# Altium schematic sheet LTC6952.SchDoc
size A3
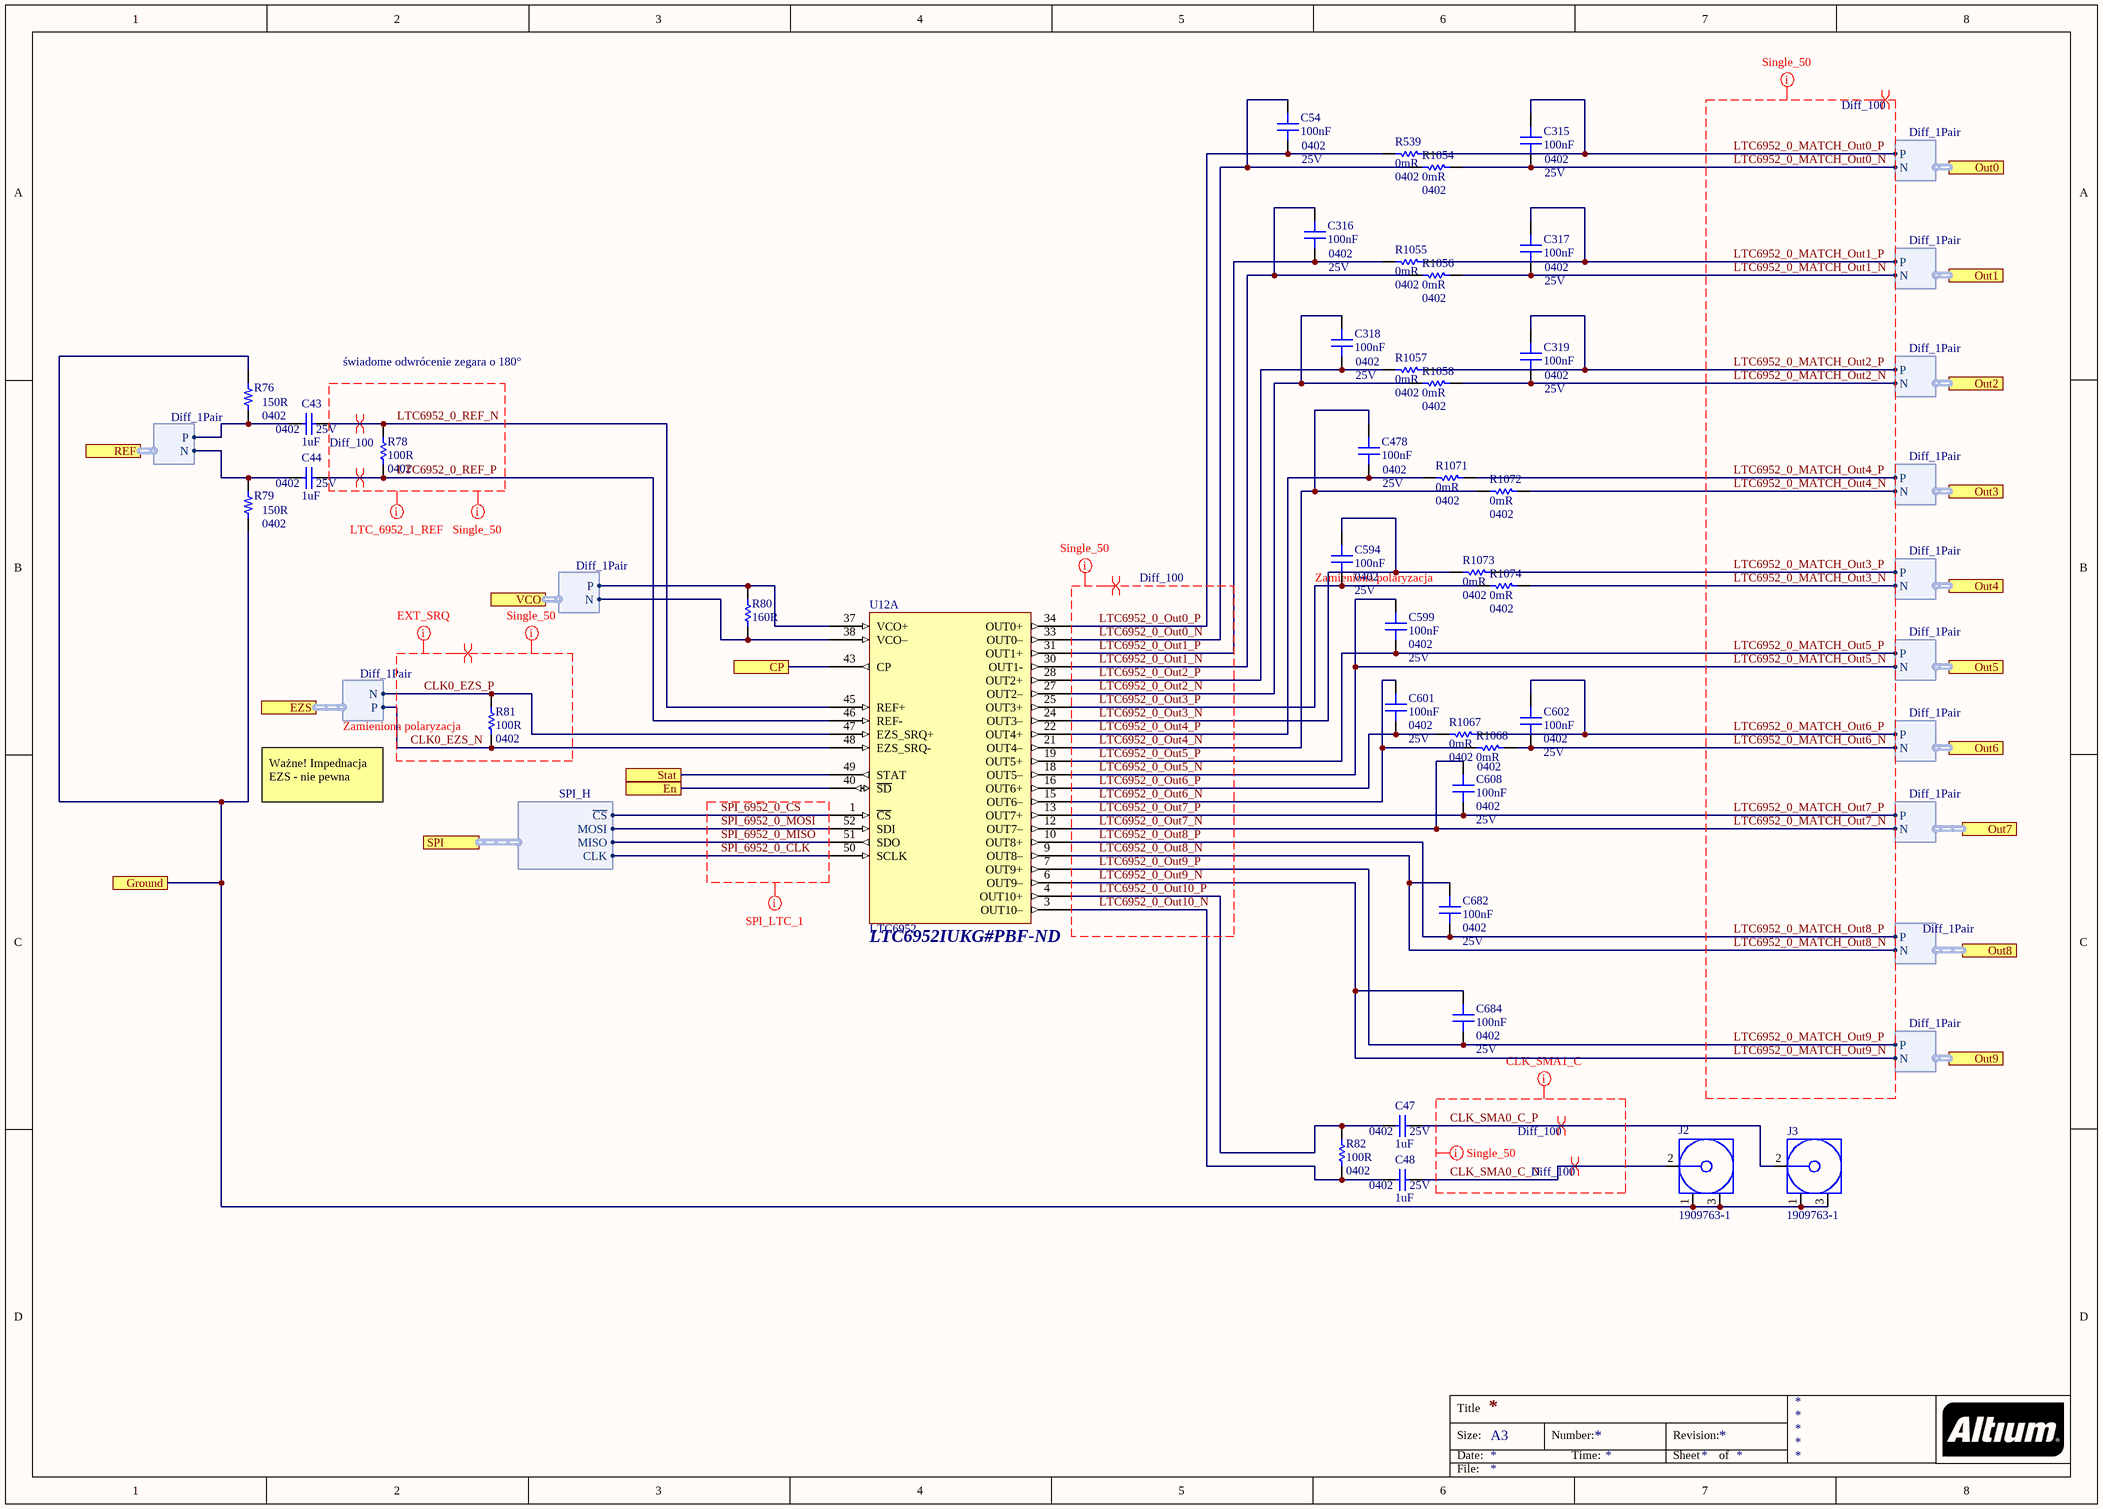
[diagram p0: LTC6952.SchDoc]

## Parts
C43  1uF  Case/Package: 0402  Voltage Rating: 25V  [CAP 0402/1005 KK]
C44  1uF  Case/Package: 0402  Voltage Rating: 25V  [CAP 0402/1005 KK]
C47  1uF  Case/Package: 0402  Voltage Rating: 25V  [CAP 0402/1005 KK]
C48  1uF  Case/Package: 0402  Voltage Rating: 25V  [CAP 0402/1005 KK]
C54  100nF  Case/Package: 0402  Voltage Rating: 25V  [CAP 0402/1005 KK]
C315  100nF  Case/Package: 0402  Voltage Rating: 25V  [CAP 0402/1005 KK]
C316  100nF  Case/Package: 0402  Voltage Rating: 25V  [CAP 0402/1005 KK]
C317  100nF  Case/Package: 0402  Voltage Rating: 25V  [CAP 0402/1005 KK]
C318  100nF  Case/Package: 0402  Voltage Rating: 25V  [CAP 0402/1005 KK]
C319  100nF  Case/Package: 0402  Voltage Rating: 25V  [CAP 0402/1005 KK]
C478  100nF  Case/Package: 0402  Voltage Rating: 25V  [CAP 0402/1005 KK]
C594  100nF  Case/Package: 0402  Voltage Rating: 25V  [CAP 0402/1005 KK]
C599  100nF  Case/Package: 0402  Voltage Rating: 25V  [CAP 0402/1005 KK]
C601  100nF  Case/Package: 0402  Voltage Rating: 25V  [CAP 0402/1005 KK]
C602  100nF  Case/Package: 0402  Voltage Rating: 25V  [CAP 0402/1005 KK]
C608  100nF  Case/Package: 0402  Voltage Rating: 25V  [CAP 0402/1005 KK]
C682  100nF  Case/Package: 0402  Voltage Rating: 25V  [CAP 0402/1005 KK]
C684  100nF  Case/Package: 0402  Voltage Rating: 25V  [CAP 0402/1005 KK]
J2  1909763-1  [TECO-1909763-1_V]
J3  1909763-1  [TECO-1909763-1_V]
R76  150R  Case/Package: 0402  [RES 0402/1005 RF KK]
R78  100R  Case/Package: 0402  [RES 0402/1005 RF KK]
R79  150R  Case/Package: 0402  [RES 0402/1005 RF KK]
R80  160R  [RES 0402/1005 RF KK]
R81  100R  Case/Package: 0402  [RES 0402/1005 RF KK]
R82  100R  Case/Package: 0402  [RES 0402/1005 RF KK]
R539  0mR  Case/Package: 0402  [RES 0402/1005 RF KK]
R1054  0mR  Case/Package: 0402  [RES 0402/1005 RF KK]
R1055  0mR  Case/Package: 0402  [RES 0402/1005 RF KK]
R1056  0mR  Case/Package: 0402  [RES 0402/1005 RF KK]
R1057  0mR  Case/Package: 0402  [RES 0402/1005 RF KK]
R1058  0mR  Case/Package: 0402  [RES 0402/1005 RF KK]
R1067  0mR  Case/Package: 0402  [RES 0402/1005 RF KK]
R1068  0mR  Case/Package: 0402  [RES 0402/1005 RF KK]
R1071  0mR  Case/Package: 0402  [RES 0402/1005 RF KK]
R1072  0mR  Case/Package: 0402  [RES 0402/1005 RF KK]
R1073  0mR  Case/Package: 0402  [RES 0402/1005 RF KK]
R1074  0mR  Case/Package: 0402  [RES 0402/1005 RF KK]
U12  LTC6952  Supplier Part Number 1: LTC6952IUKG#PBF-ND  [LTC6952]  (part A of 2)

## Ports
CP, En, EZS (harness Diff_1Pair), Ground, Out0 (harness Diff_1Pair), Out1 (harness Diff_1Pair), Out2 (harness Diff_1Pair), Out3 (harness Diff_1Pair), Out4 (harness Diff_1Pair), Out5 (harness Diff_1Pair), Out6 (harness Diff_1Pair), Out7 (harness Diff_1Pair), Out8 (harness Diff_1Pair), Out9 (harness Diff_1Pair), REF (harness Diff_1Pair), SPI (harness SPI_H), Stat, VCO (harness Diff_1Pair)

## Harnesses
SPI_H: CLK, MISO, MOSI, ~{CS}
Diff_1Pair: N, P

## Nets
CLK0_EZS_N: R81.1 U12.48(EZS_SRQ-) ; port EZS.P
CLK0_EZS_P: R81.2 U12.47(EZS_SRQ+) ; port EZS.N
CLK_SMA0_C_N: C48.1 J2.2
CLK_SMA0_C_P: C47.1 J3.2
CP: U12.43(CP) ; port CP
En: U12.40(~{SD}) ; port En
Ground: J2.1 J2.3 J3.1 J3.3 R76.2 R79.1 ; port Ground
LTC6952_0_MATCH_Out0_N: C315.1 R1054.1 ; port Out0.N
LTC6952_0_MATCH_Out0_P: C315.2 R539.1 ; port Out0.P
LTC6952_0_MATCH_Out1_N: C317.1 R1056.1 ; port Out1.N
LTC6952_0_MATCH_Out1_P: C317.2 R1055.1 ; port Out1.P
LTC6952_0_MATCH_Out2_N: C319.1 R1058.1 ; port Out2.N
LTC6952_0_MATCH_Out2_P: C319.2 R1057.1 ; port Out2.P
LTC6952_0_MATCH_Out3_N: R1074.1 ; port Out4.N
LTC6952_0_MATCH_Out3_P: R1073.1 ; port Out4.P
LTC6952_0_MATCH_Out4_N: R1072.2 ; port Out3.N
LTC6952_0_MATCH_Out4_P: R1071.2 ; port Out3.P
LTC6952_0_MATCH_Out5_N: C599.1 U12.18(OUT5–) ; port Out5.N  [also labelled LTC6952_0_Out5_N]
LTC6952_0_MATCH_Out5_P: C599.2 U12.19(OUT5+) ; port Out5.P  [also labelled LTC6952_0_Out5_P]
LTC6952_0_MATCH_Out6_N: C602.2 R1068.1 ; port Out6.N
LTC6952_0_MATCH_Out6_P: C602.1 R1067.1 ; port Out6.P
LTC6952_0_MATCH_Out7_N: C608.1 U12.12(OUT7–) ; port Out7.N  [also labelled LTC6952_0_Out7_N]
LTC6952_0_MATCH_Out7_P: C608.2 U12.13(OUT7+) ; port Out7.P  [also labelled LTC6952_0_Out7_P]
LTC6952_0_MATCH_Out8_N: C682.1 U12.9(OUT8–) ; port Out8.N  [also labelled LTC6952_0_Out8_N]
LTC6952_0_MATCH_Out8_P: C682.2 U12.10(OUT8+) ; port Out8.P  [also labelled LTC6952_0_Out8_P]
LTC6952_0_MATCH_Out9_N: C684.1 U12.6(OUT9–) ; port Out9.N  [also labelled LTC6952_0_Out9_N]
LTC6952_0_MATCH_Out9_P: C684.2 U12.7(OUT9+) ; port Out9.P  [also labelled LTC6952_0_Out9_P]
LTC6952_0_Out0_N: C54.2 R1054.2 U12.33(OUT0–)
LTC6952_0_Out0_P: C54.1 R539.2 U12.34(OUT0+)
LTC6952_0_Out1_N: C316.2 R1056.2 U12.30(OUT1-)
LTC6952_0_Out1_P: C316.1 R1055.2 U12.31(OUT1+)
LTC6952_0_Out2_N: C318.2 R1058.2 U12.27(OUT2–)
LTC6952_0_Out2_P: C318.1 R1057.2 U12.28(OUT2+)
LTC6952_0_Out3_N: C594.1 R1073.2 U12.24(OUT3–)
LTC6952_0_Out3_P: C594.2 R1074.2 U12.25(OUT3+)
LTC6952_0_Out4_N: C478.2 R1072.1 U12.21(OUT4–)
LTC6952_0_Out4_P: C478.1 R1071.1 U12.22(OUT4+)
LTC6952_0_Out6_N: C601.1 R1068.2 U12.15(OUT6–)
LTC6952_0_Out6_P: C601.2 R1067.2 U12.16(OUT6+)
LTC6952_0_Out10_N: C48.2 R82.1 U12.3(OUT10–)
LTC6952_0_Out10_P: C47.2 R82.2 U12.4(OUT10+)
LTC6952_0_REF_N: C43.1 R78.2 U12.45(REF+)
LTC6952_0_REF_P: C44.1 R78.1 U12.46(REF-)
SPI_6952_0_CLK: U12.50(SCLK) ; port SPI.CLK
SPI_6952_0_CS: U12.1(~{CS}) ; port SPI.~{CS}
SPI_6952_0_MISO: U12.51(SDO) ; port SPI.MISO
SPI_6952_0_MOSI: U12.52(SDI) ; port SPI.MOSI
Stat: U12.49(STAT) ; port Stat
NetC43_2: C43.2 R76.1 ; port REF.P
NetC44_2: C44.2 R79.2 ; port REF.N
NetR80_1: R80.1 U12.38(VCO–) ; port VCO.N
NetR80_2: R80.2 U12.37(VCO+) ; port VCO.P

## Layout directives
differential pair; differential pair class Diff_100: CLK0_EZS_N, CLK0_EZS_P, CLK_SMA0_C_N, CLK_SMA0_C_P, LTC6952_0_MATCH_Out0_N, LTC6952_0_MATCH_Out0_P, LTC6952_0_MATCH_Out1_N, LTC6952_0_MATCH_Out1_P, LTC6952_0_MATCH_Out2_N, LTC6952_0_MATCH_Out2_P, LTC6952_0_MATCH_Out3_N, LTC6952_0_MATCH_Out3_P, LTC6952_0_MATCH_Out4_N, LTC6952_0_MATCH_Out4_P, LTC6952_0_MATCH_Out5_N, LTC6952_0_MATCH_Out5_P, LTC6952_0_MATCH_Out6_N, LTC6952_0_MATCH_Out6_P, LTC6952_0_MATCH_Out7_N, LTC6952_0_MATCH_Out7_P, LTC6952_0_MATCH_Out8_N, LTC6952_0_MATCH_Out8_P, LTC6952_0_MATCH_Out9_N, LTC6952_0_MATCH_Out9_P, LTC6952_0_Out0_N, LTC6952_0_Out0_P, LTC6952_0_Out1_N, LTC6952_0_Out1_P, LTC6952_0_Out2_N, LTC6952_0_Out2_P, LTC6952_0_Out3_N, LTC6952_0_Out3_P, LTC6952_0_Out4_N, LTC6952_0_Out4_P, LTC6952_0_Out5_N, LTC6952_0_Out5_P, LTC6952_0_Out6_N, LTC6952_0_Out6_P, LTC6952_0_Out7_N, LTC6952_0_Out7_P, LTC6952_0_Out8_N, LTC6952_0_Out8_P, LTC6952_0_Out9_N, LTC6952_0_Out9_P, LTC6952_0_Out10_N, LTC6952_0_Out10_P, LTC6952_0_REF_N, LTC6952_0_REF_P
net class Single_50: CLK0_EZS_N, CLK0_EZS_P, CLK_SMA0_C_N, CLK_SMA0_C_P, LTC6952_0_MATCH_Out0_N, LTC6952_0_MATCH_Out0_P, LTC6952_0_MATCH_Out1_N, LTC6952_0_MATCH_Out1_P, LTC6952_0_MATCH_Out2_N, LTC6952_0_MATCH_Out2_P, LTC6952_0_MATCH_Out3_N, LTC6952_0_MATCH_Out3_P, LTC6952_0_MATCH_Out4_N, LTC6952_0_MATCH_Out4_P, LTC6952_0_MATCH_Out5_N, LTC6952_0_MATCH_Out5_P, LTC6952_0_MATCH_Out6_N, LTC6952_0_MATCH_Out6_P, LTC6952_0_MATCH_Out7_N, LTC6952_0_MATCH_Out7_P, LTC6952_0_MATCH_Out8_N, LTC6952_0_MATCH_Out8_P, LTC6952_0_MATCH_Out9_N, LTC6952_0_MATCH_Out9_P, LTC6952_0_Out0_N, LTC6952_0_Out0_P, LTC6952_0_Out1_N, LTC6952_0_Out1_P, LTC6952_0_Out2_N, LTC6952_0_Out2_P, LTC6952_0_Out3_N, LTC6952_0_Out3_P, LTC6952_0_Out4_N, LTC6952_0_Out4_P, LTC6952_0_Out5_N, LTC6952_0_Out5_P, LTC6952_0_Out6_N, LTC6952_0_Out6_P, LTC6952_0_Out7_N, LTC6952_0_Out7_P, LTC6952_0_Out8_N, LTC6952_0_Out8_P, LTC6952_0_Out9_N, LTC6952_0_Out9_P, LTC6952_0_Out10_N, LTC6952_0_Out10_P, LTC6952_0_REF_N, LTC6952_0_REF_P
net class CLK_SMA1_C: CLK_SMA0_C_N, CLK_SMA0_C_P
net class LTC_6952_1_REF: LTC6952_0_REF_N, LTC6952_0_REF_P
net class EXT_SRQ: CLK0_EZS_N, CLK0_EZS_P
net class SPI_LTC_1: SPI_6952_0_CLK, SPI_6952_0_CS, SPI_6952_0_MISO, SPI_6952_0_MOSI

## Notes on the sheet
- świadome odwrócenie zegara o 180°
- (near C594) Zamieniona polaryzacja
- (near R81) Zamieniona polaryzacja
- Ważne! Impednacja EZS - nie pewna
- Title
- Size:
- Date:
- A3
- Number:
- Time:
- Revision:
- Sheet
- of
- File:

## Library data of the parts
C43 C44 C47 C48 = Capacitor: MURATA - GRT155R61E105KE01D - SMD Multilayer Ceramic Capacitor, 1 µF, 25 V, 0402 [1005 Metric], ± 10%, X5R, GRT Series - SMD Multilayer Ceramic Capacitor, 1 µF, 25 V, 0402 [1005 Metric], ± 10%, X5R, GRT Series; Supplier 1: Digi-Key; Supplier Part Number 1: 490-12263-1-ND; Manufacturer: Murata; Manufacturer Part Number: GRT155R61E105KE01D; RoHS: Yes; Category: Ceramic Capacitors; Stock 1: 341453; Pricing 1: 1=0,18000, 10=0,12300, 100=0,06210, 500=0,04248, 1000=0,03758, 2500=0,03594, 5000=0,03268 (USD); Mount: Surface Mount; Case Code (Metric): 1005; Case Code (Imperial): 0402; Min Operating Temperature: -55°C; Max Operating Temperature: 85°C; Packaging: Tape and Reel; Capacitance: 1uF; Tolerance: 10%; Dielectric: X5R; Voltage Rating (DC): 25V; Length: 0.039inch; Width: 0.02inch; Thickness: 0.022inch; Ratings: AEC-Q200; ComponentLink1URL: http://www.farnell.com/datasheets/2165918.pdf?src-supplier=Farnell; ComponentLink1Description: http://www.farnell.com/datasheets/2165918.pdf?src-supplier=Farnell; ComponentLink2URL: http://search.murata.co.jp/Ceramy/image/img/A01X/G101/ENG/GRT155R61E105KE01-01.pdf?src-supplier=Digi-Key; ComponentLink2Description: http://search.murata.co.jp/Ceramy/image/img/A01X/G101/ENG/GRT155R61E105KE01-01.pdf?src-supplier=Digi-Key; ComponentLink3URL: http://www.farnell.com/datasheets/2165918.pdf?src-supplier=Element14; ComponentLink3Description: http://www.farnell.com/datasheets/2165918.pdf?src-supplier=Element14
C54 C315-C319 C478 C594 C599 C601 C602 C608 C682 C684 = Capacitor: Manufacturer: Murata; Manufacturer Part Number: GRM155R71E104KE14J; Tolerance: 10%; Dielectric: X7R; Supplier 1: Digi-Key; Supplier Part Number 1: 490-14603-1-ND; Stock 1: 89275; Pricing 1: 1 = 0,10000, 10 = 0,03400, 100 = 0,01520, 500 = 0,01088, 1000 = 0,00855, 2500 = 0,00778, 5000 = 0,00715 (USD); RoHS: Yes; Mount: Surface Mount; Weight: 0.000212oz; Case Code (Imperial): 0402; Case Code (Metric): 1005; Min Operating Temperature: -55°C; Max Operating Temperature: 125°C; Packaging: Tape and Reel; Capacitance: 100nF; Termination: SMD/SMT; Composition: Ceramic; Voltage Rating (DC): 25V; Package Quantity: 50000; Length: 0.039inch; Height: 0.5mm; Width: 0.5mm; Thickness: 0.022inch; ComponentLink1URL: http://www.mouser.com/ds/2/281/c02e-2905.pdf?src-supplier=Mouser; ComponentLink1Description: http://www.mouser.com/ds/2/281/c02e-2905.pdf?src-supplier=Mouser; ComponentLink2URL: http://search.murata.co.jp/Ceramy/image/img/A01X/G101/ENG/GRM155R71E104KE14-01.pdf?src-supplier=Digi-Key; ComponentLink2Description: http://search.murata.co.jp/Ceramy/image/img/A01X/G101/ENG/GRM155R71E104KE14-01.pdf?src-supplier=Digi-Key
J2 J3 = 1909763-1: Ultra Miniature Coaxial Connector Jack, 60 V, 50 Ohm, -40 to 90 degC, RoHS, Tape and Reel; Brand: TE Connectivity / AMP; Maximum Frequency: 6 GHz; Gender: Jack (Female); Body Material: Liquid Crystal Polymer (LCP); RF Series: UMCC; Impedance: 50 Ohms; DatasheetVersion: Rev. B2; PackageReference: SMD; PackageDescription: 3-Pin Surface Mount Device, Body 2.6 x 2.6 mm; Supplier 1: Newark; Supplier Part Number 1: 62X0488; Supplier 2: Farnell; Supplier Part Number 2: 2781689; Supplier 3: Digi-Key; Supplier Part Number 3: A118077TR-ND; Supplier 4: Digi-Key; Supplier Part Number 4: A118077CT-ND; Supplier 5: Digi-Key; Supplier Part Number 5: A118077DKR-ND; Product Category: RF Connectors / Coaxial Connectors; Packaging: Reel; Product: Connectors; Orientation: Straight; Operating Temperature Range: - 40 C to + 90 C; Factory Pack Quantity: 5000; RoHS: Details; Contact Plating: Gold; Contact Material: Copper Alloy; Mounting Technology: Surface Mount; ComponentLink1Description: Manufacturer URL; ComponentLink1URL: http://www.te.com; ComponentLink2Description: Datasheet; ComponentLink2URL: http://www.te.com/commerce/DocumentDelivery/DDEController?Action=srchrtrv&DocNm=1909763&DocType=Customer+Drawing&DocLang=English
R76 R79 = Resistor: RES SMD 150 OHM 1% 1/10W 0402; Manufacturer: Panasonic; Manufacturer Part Number: ERJ-2RKF1500X; Temperature Coefficient: 100ppm/°C; Power Rating: 100mW; Voltage Rating: 50V; Supplier 1: Digi-Key; Supplier Part Number 1: P150LCT-ND; RoHS: Yes; Category: Chip SMD Resistors; Stock 1: 1074892; Pricing 1: 1=0,10000, 10=0,04100, 100=0,01670, 1000=0,00751, 2500=0,00652, 5000=0,00538 (USD); Mount: Surface Mount; Number of Pins: 2; Contact Plating: Tin; Case Code (Metric): 1005; Case Code (Imperial): 0402; Min Operating Temperature: -55°C; Max Operating Temperature: 155°C; Resistance: 150R; Tolerance: 1%; Composition: Thick Film; Packaging: Tape and Reel; Package Quantity: 1; Number of Terminations: 2; Termination: SMD/SMT; Military Standard: Not; Max Power Dissipation: 100mW; Voltage Rating (DC): 50V; Features: Automotive AEC-Q200; Length: 1mm; Height: 0.35mm; Width: 0.02inch; Depth: 0.5mm; Radiation Hardening: No; REACH SVHC: No SVHC; Lead Free: Lead Free; ComponentLink1URL: https://datasheet.ciiva.com/34303/1987126-34303555.pdf?src-supplier=Jameco; ComponentLink1Description: https://datasheet.ciiva.com/34303/1987126-34303555.pdf?src-supplier=Jameco; ComponentLink2URL: https://datasheet.ciiva.com/11821/0900766b80f80784-11821183.pdf?src-supplier=RSComponents; ComponentLink2Description: https://datasheet.ciiva.com/11821/0900766b80f80784-11821183.pdf?src-supplier=RSComponents; ComponentLink3URL: https://datasheet.ciiva.com/16774/70260748-16774549.pdf?src-supplier=Allied+Electronics; ComponentLink3Description: https://datasheet.ciiva.com/16774/70260748-16774549.pdf?src-supplier=Allied+Electronics; ComponentLink4URL: https://datasheet.ciiva.com/43467/1678782-43467237.pdf?src-supplier=Farnell; ComponentLink4Description: https://datasheet.ciiva.com/43467/1678782-43467237.pdf?src-supplier=Farnell; ComponentLink5URL: https://datasheet.ciiva.com/7887/426256-7887016.pdf?src-supplier=Element14; ComponentLink5Description: https://datasheet.ciiva.com/7887/426256-7887016.pdf?src-supplier=Element14; ComponentLink6URL: https://datasheet.ciiva.com/16371/aoa0000ce2-16371497.pdf?src-supplier=Future+Electronics; ComponentLink6Description: https://datasheet.ciiva.com/16371/aoa0000ce2-16371497.pdf?src-supplier=Future+Electronics; ComponentLink7URL: https://datasheet.ciiva.com/7886/aoa0000ce2-7886714.pdf?src-supplier=Element14; ComponentLink7Description: https://datasheet.ciiva.com/7886/aoa0000ce2-7886714.pdf?src-supplier=Element14; ComponentLink8URL: https://datasheet.ciiva.com/46373/1678782-46373162.pdf?src-supplier=Element14; ComponentLink8Description: https://datasheet.ciiva.com/46373/1678782-46373162.pdf?src-supplier=Element14; ComponentLink9URL: https://datasheet.ciiva.com/46373/1678782-46373163.pdf?src-supplier=Element14; ComponentLink9Description: https://datasheet.ciiva.com/46373/1678782-46373163.pdf?src-supplier=Element14; ComponentLink10URL: https://datasheet.ciiva.com/16770/70260748-16770572.pdf?src-supplier=Allied+Electronics; ComponentLink10Description: https://datasheet.ciiva.com/16770/70260748-16770572.pdf?src-supplier=Allied+Electronics; ComponentLink11URL: https://datasheet.ciiva.com/17207/aoa0000ce2-17207389.pdf?src-supplier=Avnet+Europe; ComponentLink11Description: https://datasheet.ciiva.com/17207/aoa0000ce2-17207389.pdf?src-supplier=Avnet+Europe; ComponentLink12URL: https://datasheet.ciiva.com/28568/1678782-28568846.pdf?src-supplier=Element14; ComponentLink12Description: https://datasheet.ciiva.com/28568/1678782-28568846.pdf?src-supplier=Element14; ComponentLink13URL: https://datasheet.ciiva.com/30106/aoa0000ce2-30106926.pdf?src-supplier=Onlinecomponents.com; ComponentLink13Description: https://datasheet.ciiva.com/30106/aoa0000ce2-30106926.pdf?src-supplier=Onlinecomponents.com; ComponentLink14URL: https://datasheet.ciiva.com/22673/1678782-22673679.pdf?src-supplier=Element14; ComponentLink14Description: https://datasheet.ciiva.com/22673/1678782-22673679.pdf?src-supplier=Element14
R78 R81 R82 = Resistor: RES SMD 100 OHM 1% 1/16W 0402; Manufacturer: Yageo; Manufacturer Part Number: RC0402FR-07100RL; Power Rating: 62.5mW; Voltage Rating: 50V; Temperature Coefficient: 100ppm/°C; Supplier 1: Digi-Key; Supplier Part Number 1: 311-100LRDKR-ND; RoHS: Yes; Category: Chip SMD Resistors; Stock 1: 42078262; Pricing 1: 1=0,10000, 10=0,01600, 100=0,00640, 1000=0,00289, 2500=0,00251, 5000=0,00207 (USD); Number of Pins: 2; Case Code (Imperial): 0402; Case Code (Metric): 1005; Min Operating Temperature: -55°C; Max Operating Temperature: 155°C; Tolerance: 1%; Resistance: 100R; Packaging: Tape and Reel; Termination: SMD/SMT; Composition: Thick Film; Military Standard: Not; Voltage Rating (DC): 50V; Length: 1mm; Height: 0.32mm; Depth: 0.5mm; Width: 0.5mm; REACH SVHC: No SVHC; Lead Free: Lead Free; ComponentLink1URL: https://datasheet.ciiva.com/7849/1784430-7849810.pdf?src-supplier=Element14; ComponentLink1Description: https://datasheet.ciiva.com/7849/1784430-7849810.pdf?src-supplier=Element14; ComponentLink2URL: https://datasheet.ciiva.com/11808/0900766b80c66297-11808765.pdf?src-supplier=RSComponents; ComponentLink2Description: https://datasheet.ciiva.com/11808/0900766b80c66297-11808765.pdf?src-supplier=RSComponents; ComponentLink3URL: https://datasheet.ciiva.com/12667/pyu-rc0402-51-rohs-l-6-r-12667957.pdf?src-supplier=Mouser; ComponentLink3Description: https://datasheet.ciiva.com/12667/pyu-rc0402-51-rohs-l-6-r-12667957.pdf?src-supplier=Mouser; ComponentLink4URL: https://datasheet.ciiva.com/16740/pyu-rc0402-51-rohs-l-6-r-16740566.pdf?src-supplier=Future+Electronics; ComponentLink4Description: https://datasheet.ciiva.com/16740/pyu-rc0402-51-rohs-l-6-r-16740566.pdf?src-supplier=Future+Electronics; ComponentLink5URL: https://datasheet.ciiva.com/15189/getdatasheetpartid-329466-15189335.pdf?src-supplier=Verical; ComponentLink5Description: https://datasheet.ciiva.com/15189/getdatasheetpartid-329466-15189335.pdf?src-supplier=Verical; ComponentLink6URL: https://datasheet.ciiva.com/28367/1018594-28367226.pdf?src-supplier=Element14; ComponentLink6Description: https://datasheet.ciiva.com/28367/1018594-28367226.pdf?src-supplier=Element14; ComponentLink7URL: https://datasheet.ciiva.com/22747/1018594-22747511.pdf?src-supplier=Element14; ComponentLink7Description: https://datasheet.ciiva.com/22747/1018594-22747511.pdf?src-supplier=Element14
R80 = Resistor: Res Thick Film 0402 160 Ohm 1% 1/16W 100ppm/C Molded SMD SMD Paper T/R; Manufacturer: Stackpole Electronics; Manufacturer Part Number: RMCF0402FT160R; Temperature Coefficient: 100ppm/°C; Supplier 1: Digi-Key; Supplier Part Number 1: RMCF0402FT160RCT-ND; RoHS: Yes; Category: Chip SMD Resistors; Stock 1: 34661; Pricing 1: 1=0,10000, 10=0,01400, 100=0,00580, 1000=0,00262, 2500=0,00228, 5000=0,00188 (USD); Mount: Surface Mount; Case/Package: 0402; Contact Plating: Tin,Matte; Min Operating Temperature: -55°C; Max Operating Temperature: 155°C; Packaging: Tape and Reel; Resistance: 160R; Tolerance: 1%; Composition: Thick Film; Radiation Hardening: No; ComponentLink1URL: https://www.seielect.com/catalog/SEI-RMCF_RMCP.pdf?src-supplier=Avnet; ComponentLink1Description: https://www.seielect.com/catalog/SEI-RMCF_RMCP.pdf?src-supplier=Avnet
R539 R1054-R1058 R1067 R1068 R1071-R1074 = Resistor: Manufacturer 1: Yageo; Manufacturer Part Number 1: RC0402JR-070RL; Power Rating: 62.5mW; Tolerance: 5%; Voltage Rating: 50V; Max Power Dissipation: 63mW; Temperature Coefficient: 200ppm/°C; Supplier 1: Digi-Key; Supplier Part Number 1: 311-0.0JRCT-ND; Stock 1: 69822252; Pricing 1: 1=0.10000, 10=0.01200, 25=0.00920, 50=0.00680, 100=0.00510, 250=0.00388, 500=0.00308, 1000=0.00227, 5000=0.00163 (USD); RoHS: Yes; Contact Plating: Tin,Matte; Case Code (Metric): 1005; Case Code (Imperial): 0402; Min Operating Temperature: -55°C; Max Operating Temperature: 155°C; Resistance: 0mR; Packaging: Tape and Reel; Composition: Thick Film; Package Quantity: 1; Number of Terminations: 2; Termination: SMD/SMT; Military Standard: Not; Features: Moisture Resistant; Length: 1mm; Height: 0.016inch; Width: 0.02inch; Depth: 0.5mm; Radiation Hardening: No; REACH SVHC: Unknown; Lead Free: Lead Free; ComponentLink1URL: https://datasheet.ciiva.com/2452/pyu-rc0402-51-rohs-l-6-2452608.pdf?src-supplier=Digi-Key; ComponentLink1Description: https://datasheet.ciiva.com/2452/pyu-rc0402-51-rohs-l-6-2452608.pdf?src-supplier=Digi-Key; ComponentLink2URL: https://datasheet.ciiva.com/11808/0900766b80c66297-11808195.pdf?src-supplier=RSComponents; ComponentLink2Description: https://datasheet.ciiva.com/11808/0900766b80c66297-11808195.pdf?src-supplier=RSComponents; ComponentLink3URL: https://datasheet.ciiva.com/2452/pyu-r-int-thick-7-2452609.pdf?src-supplier=Digi-Key; ComponentLink3Description: https://datasheet.ciiva.com/2452/pyu-r-int-thick-7-2452609.pdf?src-supplier=Digi-Key; ComponentLink4URL: https://datasheet.ciiva.com/22747/1018594-22747515.pdf?src-supplier=Element14; ComponentLink4Description: https://datasheet.ciiva.com/22747/1018594-22747515.pdf?src-supplier=Element14; ComponentLink5URL: https://datasheet.ciiva.com/7983/1018594-7983535.pdf?src-supplier=Element14; ComponentLink5Description: https://datasheet.ciiva.com/7983/1018594-7983535.pdf?src-supplier=Element14; ComponentLink6URL: https://datasheet.ciiva.com/2452/pyu-r-int-thick-7-2452610.pdf?src-supplier=Digi-Key; ComponentLink6Description: https://datasheet.ciiva.com/2452/pyu-r-int-thick-7-2452610.pdf?src-supplier=Digi-Key; ComponentLink7URL: https://datasheet.ciiva.com/8896/pyu-rc0402-51-rohs-l-6-8896201.pdf?src-supplier=Avnet; ComponentLink7Description: https://datasheet.ciiva.com/8896/pyu-rc0402-51-rohs-l-6-8896201.pdf?src-supplier=Avnet; ComponentLink8URL: https://datasheet.ciiva.com/28386/pyu-rc0402-51-rohs-l-6-28386633.pdf?src-supplier=Avnet+Europe; ComponentLink8Description: https://datasheet.ciiva.com/28386/pyu-rc0402-51-rohs-l-6-28386633.pdf?src-supplier=Avnet+Europe; ComponentLink9URL: https://datasheet.ciiva.com/15189/getdatasheetpartid-326379-15189533.pdf?src-supplier=Verical; ComponentLink9Description: https://datasheet.ciiva.com/15189/getdatasheetpartid-326379-15189533.pdf?src-supplier=Verical
U12 = LTC6952: Dystrybutor Zegarów; Manufacturer: Analog Devices; Manufacturer Part Number: LTC6952IUKG#PBF; Supplier 1: Digi-Key; Stock 1: 267; Pricing 1: 1 = 30,78000, 25 = 24,62680, 100 = 21,36000, 250 = 20,50564, 500 = 19,86492 (USD); RoHS: No; Number of Pins: 52